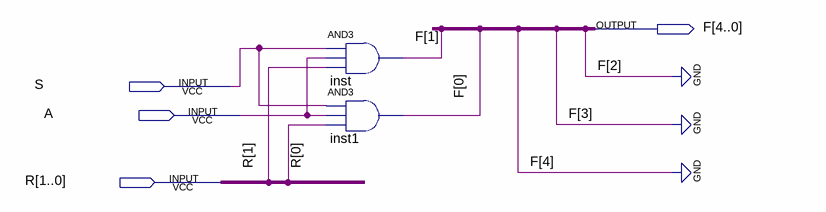
[diagram p0: schematic sheet]
// Quartus schematic and_2seletor_3bits.bdf as structural Verilog: 2 symbols, 4 pins
module and_2seletor_3bits (
  input  S,
  input  A,
  input  [1:0] R,
  output [4:0] F
);

  and inst (F[1], S, A, R[1]);
  and inst1 (F[0], S, A, R[0]);

  assign F[4:2] = 3'b000;
endmodule
